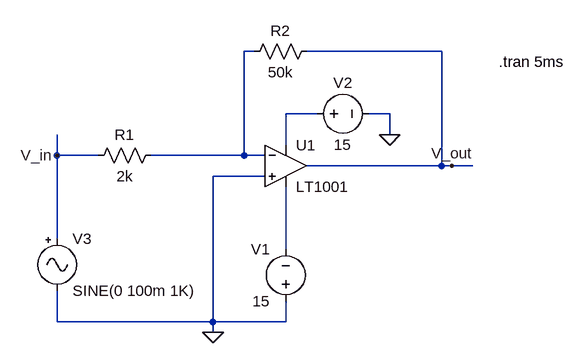
[diagram p0: schematic Draft1.asc]
Draft1.asc, the LTspice schematic file:
Version 4
SHEET 1 880 680
WIRE 112 -16 96 -16
WIRE 400 -16 192 -16
WIRE 208 80 160 80
WIRE 320 80 288 80
WIRE 320 112 320 80
WIRE 160 128 160 80
WIRE -192 144 -192 112
WIRE -128 144 -192 144
WIRE 96 144 96 -16
WIRE 96 144 -48 144
WIRE 128 144 96 144
WIRE 400 160 400 -16
WIRE 400 160 192 160
WIRE 416 160 400 160
WIRE 448 160 416 160
WIRE 128 176 48 176
WIRE -192 272 -192 144
WIRE 160 288 160 192
WIRE -192 400 -192 352
WIRE 48 400 48 176
WIRE 48 400 -192 400
WIRE 160 400 160 368
WIRE 160 400 48 400
WIRE 48 416 48 400
FLAG 320 112 0
FLAG 48 416 0
FLAG -192 144 V_in
FLAG 416 160 V_out
SYMBOL OpAmps\\LT1001 160 96 R0
SYMATTR InstName U1
SYMBOL res 208 -32 R90
WINDOW 0 0 56 VBottom 2
WINDOW 3 32 56 VTop 2
SYMATTR InstName R2
SYMATTR Value 50k
SYMBOL voltage 192 80 R270
WINDOW 0 32 56 VTop 2
WINDOW 3 -32 56 VBottom 2
SYMATTR InstName V2
SYMATTR Value 15
SYMBOL res -32 128 R90
WINDOW 0 0 56 VBottom 2
WINDOW 3 32 56 VTop 2
SYMATTR InstName R1
SYMATTR Value 2k
SYMBOL voltage 160 384 R180
WINDOW 0 24 96 Left 2
WINDOW 3 24 16 Left 2
SYMATTR InstName V1
SYMATTR Value 15
SYMBOL Misc\\signal -192 256 R0
SYMATTR InstName V3
SYMATTR Value SINE(0 100m 1K)
TEXT 488 0 Left 2 !.tran 5ms

The netlist it stands for:
* Draft1.asc
XU1 0 N001 N002 N003 V_out LT1001  ; pins In+ In- V+ V- OUT
R2 V_out N001 50k
V2 N002 0 15
R1 N001 V_in 2k
V1 0 N003 15
V3 V_in 0 SINE(0 100m 1K)
.tran 5ms
.lib LTC.lib
.backanno
.end